# Altium project Termination-Board-V1.0.1.PrjPcb
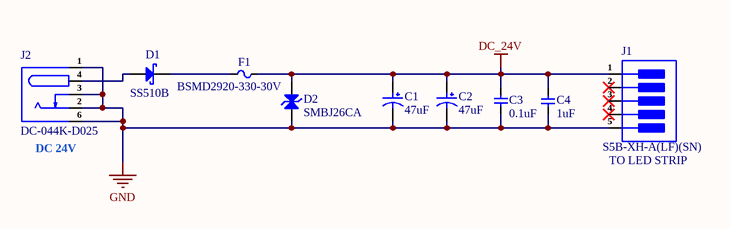
[diagram p0: Main-Sheet.SchDoc]
1 sheet, 9 parts. Net scope: global (net labels, ports and power ports of the same name join across sheets).
Board file: Termination-Board-v1.0.1-PCB.PcbDoc

## Sheet Main-Sheet.SchDoc: Title
size A4; Date: *******; ApprovedBy: *******; CheckedBy: None; Author: *******; CompanyName: *******; DrawnBy: Name; Engineer: *******; Organization: *******; Address1: *******; Address2: *******; Address3: *******; Address4: *******; DocumentNumber: Doc Num; Revision: *******; SheetNumber: 1; SheetTotal: 1; CurrentTime: *******; CurrentDate: *******; Time: *******; DocumentFullPathAndName: *******; DocumentName: *******; ModifiedDate: *******; ImagePath: *******; ProjectName: *******; Application_BuildNumber: *******

### Parts
C1  47uF  [RVT1H470M0607]
C2  47uF  [RVT1H470M0607]
C3  0.1uF  [Cap-0603]
C4  1uF  [Cap-0805]
D1  SS510B  [SMB_]
D2  SMBJ26CA  [SMB Bi Directional]
F1  BSMD2920-330-30V  [Fuse-2920]
J1  S5B-XH-A(LF)(SN)  [S5B-XH-A(LF)(SN)]
J2  DC-044K-D025  [DC-044K-D025]

### Nets
DC_24V: C1.1 C2.1 C3.1 C4.2 D2.2(K) F1.2 J1.1
GND: C1.2 C2.2 C3.2 C4.1 D2.1(A) J1.5 J2.1 J2.2 J2.3 J2.6
NetD1_1: D1.1(A) J2.4
NetD1_2: D1.2(K) F1.1

Not connected (* = marked no-connect by the designer): J1 2* 3* 4*

### Notes on the sheet
- (near J2) DC 24V
- (near J1) TO LED STRIP
- File:
- Title:
- Date:
- Page
- Num:
- Total:
- Drawn By: Huzaifa Ali

### Library data of the parts
C1 C2 = RVT1H470M0607: 47uF 50V 66mA@120Hz ±20% SMD,D6.3xL7.7mm Aluminum Electrolytic Capacitors - SMD ROHS; Manufacturer: ROQANG; Manufacturer Part Number: RVT1H470M0607; Package: SMD,D6.3xL7.7mm; LCSC Part Number: C72523; Item Type: Capacitor; ComponentLink1Description: LCSC; ComponentLink1URL: https://www.lcsc.com/product-detail/Aluminum-Electrolytic-Capacitors-SMD_ROQANG-RVT1H470M0607_C72523.html
C3 = CC0603JRX7R9BB104: CAP CER 0.1UF 50V X7R 0603; Manufacturer: Yageo; Item Type: Capacitors; Material: 4241ConductorMaterial; Supplier: Future Electronics; LCSC Part Number: C91183; Manufacturer Part Number: CC0603JRX7R9BB104; RoHS: Yes; Stock: 204000; Pricing: 4000=0.0077, 16000=0.0073, 60000=0.007, 160000=0.0068, 400000=0.0064 (USD); Pins: 2NUMBER; Lead Free: 5697LeadFree; Halogen Free: 5694HalogenFree; ComponentLink1URL: https://datasheet.ciiva.com/11465/upy-gphc-x7r-6-3v-to-50v-8-11465038.pdf?src-supplier=Avnet; ComponentLink1Description: https://datasheet.ciiva.com/11465/upy-gphc-x7r-6-3v-to-50v-8-11465038.pdf?src-supplier=Avnet
C4 = GCM21BC72A105KE36L: CAP CER 1UF 100V X7S 0805; Manufacturer: Murata; Tolerance: 10%; Supplier 1: Digi-Key; Manufacturer Part Number: GCM21BC72A105KE36L; RoHS: Yes; Category: Ceramic Capacitors; Stock 1: 179138; Pricing 1: 1=0.48000, 10=0.34100, 50=0.25800, 100=0.22480, 500=0.16650, 1000=0.14152 (USD); Mount: Surface Mount; Case/Package: 0805; Case Code (Imperial): 0805; Case Code (Metric): 2012; Min Operating Temperature: -55°C; Max Operating Temperature: 125°C; Packaging: Cut Tape; Capacitance: 1uF; Voltage Rating: 100V; Ratings: AEC-Q200; RoHS Compliant: Yes; ComponentLink1URL: http://search.murata.co.jp/Ceramy/image/img/A01X/partnumbering_e_02.pdf?src-supplier=Digi-Key; ComponentLink1Description: http://search.murata.co.jp/Ceramy/image/img/A01X/partnumbering_e_02.pdf?src-supplier=Digi-Key; Supplier Part Number 1: 490-14436-1-ND; LCSC Part Number: C2842838
D1 = SS510B: SCHOTTKY DIODE SMB 100V 5A; Manufacturer: MDD; Manufacturer Part Number: SS510B; Package: SMB; ComponentLink1Description: LCSC; ComponentLink1URL: https://www.lcsc.com/product-detail/Schottky-Barrier-Diodes-SBD_JUXING-SS510B_C3011128.html; LCSC Part Number: C3011128; Item Type: Diode
D2 = SMBJ26CA: SMB(DO-214AA) TVS ROHS; Manufacturer: MSKSEMI; Item Type: Diode; Manufacturer Part Number: SMBJ26CA; Package: SMB(DO-214AA); LCSC Part Number: C5331111; ComponentLink1Description: LCSC; ComponentLink1URL: https://www.lcsc.com/product-detail/TVS_MSKSEMI-SMBJ26CA_C5331111.html
F1 = BSMD2920-330-30V: 30V 3.3A 40A 6.6A 2920 Resettable Fuses ROHS; Manufacturer: BHFUSE; Item Type: Fuse; Supplier: LCSC; LCSC Part Number: C22368176; Manufacturer Part Number: BSMD2920-330-30V; RoHS: No; ComponentLink1Description: LCSC; ComponentLink1URL: https://www.lcsc.com/product-detail/Resettable-Fuses_BHFUSE-BSMD2920-330-30V_C22368176.html
J1 = S5B-XH-A(LF)(SN): CONN HEADER R/A 5POS 2.5MM; Manufacturer: JST; Item Type: Headers and Wire Housings; Current Rating: 3A; Voltage Rating: 250V; Number of Positions: 5; Supplier: Future Electronics; LCSC Part Number: C263757; Manufacturer Part Number: S5B-XH-A(LF)(SN); RoHS: Yes; Stock: 1881; Pricing: 1=0.145, 250=0.141, 1000=0.135, 2500=0.131, 10000=0.123 (USD); Mounting Technology: Through Hole; Contact Material: Brass; Contact Shape: Square; Insulation Material: Nylon; Insulation Color: Natural; Contact Finish - Mating: TIN; Contact Plating: Tin; Weight: 4.535924g; Min Operating Temperature: -25°C; Max Operating Temperature: 85°C; Number of Rows: 1; Packaging: Bulk; Termination: Solder; Fastening Type: Detent; Number of Contacts: 5; Connector Type: Header; Series: XH; Contact Type: Male Pin; Orientation: Right Angle; Pitch: 2.5mm; Flammability Rating: UL94 V-0; Lead Free: 5697LeadFree; Reach SVHC Compliant: No; ComponentLink1URL: https://datasheet.ciiva.com/16484/jst20s6b-xh-a-1-lf-sn-16484585.pdf?src-supplier=Future+Electronics; ComponentLink1Description: https://datasheet.ciiva.com/16484/jst20s6b-xh-a-1-lf-sn-16484585.pdf?src-supplier=Future+Electronics; ComponentLink2URL: https://datasheet.ciiva.com/726/exh-726399.pdf?src-supplier=Digikey; ComponentLink2Description: https://datasheet.ciiva.com/726/exh-726399.pdf?src-supplier=Digikey; ComponentLink3URL: https://datasheet.ciiva.com/8052/5448-8052216.pdf?src-supplier=Element14; ComponentLink3Description: https://datasheet.ciiva.com/8052/5448-8052216.pdf?src-supplier=Element14
J2 = DC-044K-D025: Bend insert DC Power Receptacle -30℃~+85℃ 2.5mm 6mm 7A 24V Plugin DC Power Connectors ROHS; Manufacturer: G-Switch; Manufacturer Part Number: DC-044K-D025; Package: Plugin; LCSC Part Number: C963204; Item Type: DC Power Connectors; ComponentLink1Description: LCSC; ComponentLink1URL: https://www.lcsc.com/product-detail/DC-Power-Connectors_G-Switch-DC-044K-D025_C963204.html